# Altium project MCU.PrjPcb (part 2 of 3)

## Sheet CAN.SchDoc
size A4; SheetNumber: 6; SheetTotal: 10
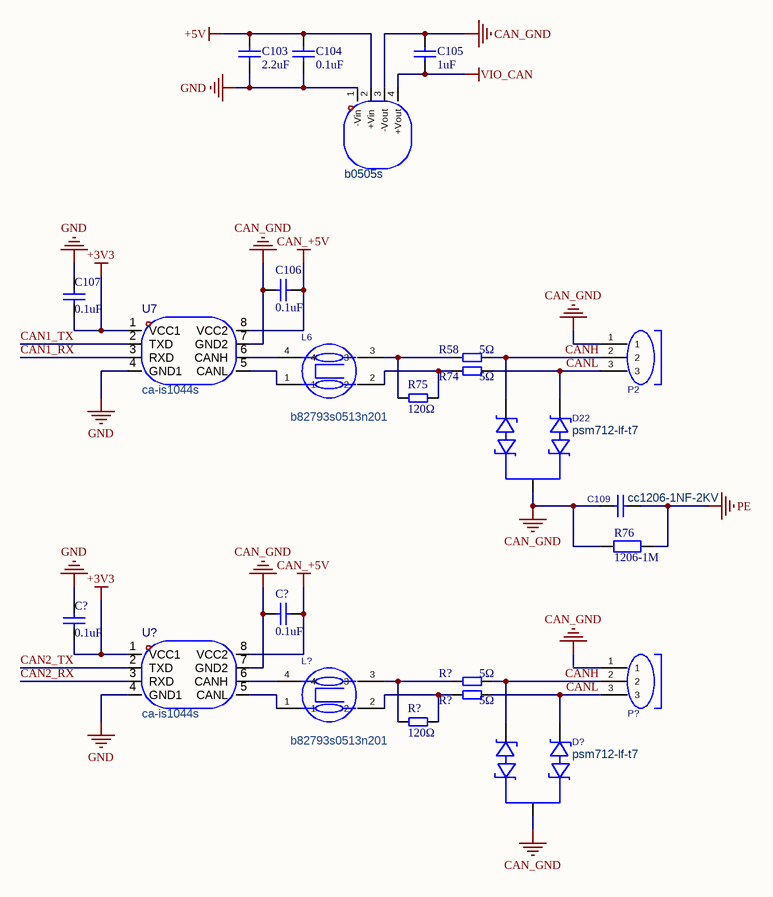
[diagram p6: CAN.SchDoc]

### Parts
(Parts that share a designator on the sheet are numbered #1, #2 ... from top to bottom, then left to right.)
C103  2.2uF  [C0603]
C104  0.1uF  [C0603]
C105  1uF  [C0603]
C106  0.1uF  [C0603]
C107  0.1uF  [C0603]
C109  cc1206-1NF-2KV  [C1206]
C?#23  0.1uF  [C0603]
C?#24  0.1uF  [C0603]
D22  psm712-lf-t7  [SOT-23-3_L3.0-W1.7-P0.95-LS2.9-BR]
D?#13  psm712-lf-t7  [SOT-23-3_L3.0-W1.7-P0.95-LS2.9-BR]
L6  b82793s0513n201  [FILTER-SMD_4P-L9.0-W6.0_B82790]
L?#2  b82793s0513n201  [FILTER-SMD_4P-L9.0-W6.0_B82790]
P2  wj500v-5.08-03p-14-00a  [CONN-TH_3P-P3.81_WJ15EDGRC-3.81-3P]  (value not drawn)
P?  wj500v-5.08-03p-14-00a  [CONN-TH_3P-P3.81_WJ15EDGRC-3.81-3P]  (value not drawn)
R58  5Ω  [R0603]
R74  5Ω  [R0603]
R75  120Ω  [R0603]
R76  1206-1M  [F1206]
R?#62  5Ω  [R0603]
R?#63  5Ω  [R0603]
R?#64  120Ω  [R0603]
U7  ca-is1044s  [SOIC-8_L4.9-W3.9-P1.27-LS6.0-BL]
U?#4  ca-is1044s  [SOIC-8_L4.9-W3.9-P1.27-LS6.0-BL]
  b0505s  [PWRM-TH_B0505S-1WR3]

### Nets
+3V3: C107.1 C?#24.1 U7.1(VCC1) U?#4.1(VCC1)
+5V: C103.2 C104.2 .2(+Vin)
CAN_+5V: C106.2 C?#23.2 U7.8(VCC2) U?#4.8(VCC2)
CAN_GND: C105.2 C106.1 C109.1 C?#23.1 D22.3(K) D?#13.3(K) P2.1 P?.1 R76.1 U7.7(GND2) U?#4.7(GND2) .3(-Vout)
GND: C103.1 C104.1 C107.2 C?#24.2 U7.4(GND1) U?#4.4(GND1) .1(-Vin)
PE: C109.2 R76.2
VIO_CAN: C105.1 .4(+Vout)
CAN1_RX: U7.3(RXD)
CAN1_TX: U7.2(TXD)
CAN2_RX: U?#4.3(RXD)
CAN2_TX: U?#4.2(TXD)
CANH: D22.2(A1) D?#13.2(A1) P2.2 P?.2 R58.2 R?#62.2
CANL: D22.1(A1) D?#13.1(A1) P2.3 P?.3 R74.2 R?#63.2
NetL6_1: L6.1 U7.5(CANL)
NetL6_2: L6.2 R74.1 R75.2
NetL6_3: L6.3 R58.1 R75.1
NetL6_4: L6.4 U7.6(CANH)
NetL?#2_1: L?#2.1 U?#4.5(CANL)
NetL?#2_2: L?#2.2 R?#63.1 R?#64.2
NetL?#2_3: L?#2.3 R?#62.1 R?#64.1
NetL?#2_4: L?#2.4 U?#4.6(CANH)

### Library data of the parts
C103-C107 C?#23 C?#24 = C0603: Capacitor; Value: 104; Published: 8-Jun-2000; LatestRevisionDate: 17-Jul-2002; LatestRevisionNote: Re-released for DXP Platform.; Publisher: Altium Limited
C109 = cc1206kkx7rdbb102: 容值:1nF;精度:±10%;额定电压:2kV;温度系数:X7R;; Manufacturer: YAGEO(国巨); AddInBom: yes; ModelId: e4be705b945545a48e666415e3682bd8; ModelName: C1206_L3.2-W1.6-H1.3; ModelTransform: 125.984,62.992,0,0,0,0,0,0,0; Value: 1nF; Tolerance: ±10%; Voltage Rating: 2kV; Temperature Coefficient: X7R; Symbol: CC1206KKX7RDBB102; LCSC Part Name: 1nF ±10% 2kV; SupplierPart: C23631; ManufacturerPart: CC1206KKX7RDBB102; Supplier Footprint: 1206; JLCPCB Part Class: Extended Part; Datasheet: https://item.szlcsc.com/datasheet/CC1206KKX7RDBB102/24367.html; Supplier: LCSC; ConvertToPcb: yes; FootprintName: C1206
D22 D?#13 = psm712-lf-t7: 极性:单向;反向截止电压(Vrwm):12V;钳位电压:19V;峰值脉冲电流(Ipp):34A@8/20us；30A@8/20us;峰值脉冲功率(Ppp):600W@8/20us;击穿电压(VBR):13.3V;; Manufacturer: PROTEK; AddInBom: yes; ModelId: 89cb27a44ab2466697082bb9fd73a7d0; ModelName: SOT-23-3L_L2.9-W1.6-H1.1-LS2.8-P0.95; ModelTransform: 114.173,110.236,0,90,0,0,0,0,0; Polarity: 单向; Reverse Stand-Off Voltage (Vrwm): 12V; Clamping Voltage: 19V; Voltage - Breakdown: 13.3V; Reverse Leakage Current (Ir): 1uA；20uA; level of protection: IEC 61000-4-4；IEC 61000-4-5；IEC 61000-4-2; Type: TVS; Junction Capacitance: 75pF; Symbol: PSM712-LF-T7; LCSC Part Name: 单向TVS 12V截止 峰值浪涌电流：34A@8/20us 30A@8/20us; SupplierPart: C32677; ManufacturerPart: PSM712-LF-T7; Supplier Footprint: SOT-23; JLCPCB Part Class: Basic Part; Datasheet: https://item.szlcsc.com/datasheet/PSM712-LF-T7/33642.html; Supplier: LCSC; ConvertToPcb: yes; FootprintName: SOT-23-3_L3.0-W1.7-P0.95-LS2.9-BR; Peak Pulse Current (Ipp): 34A@8/20us；30A@8/20us; Peak Pulse Power Dissipation (Ppp): 600W@8/20us; Operating Temperature: -55℃~+150℃
L6 L?#2 = b82793s0513n201: 通道数:2;电感@频率:51uH@100kHz;直流电阻(DCR):140mΩ;; Manufacturer: TDK; Symbol: B82793S513N201; AddInBom: yes; ModelId: 4e9188432b8b448ba84ed56da6aff49a; ModelName: FILTER-SMD_4P-L7.1-W6.0-H4.8-LS9.0; ModelTransform: 355.35937,236.22,0,90,0,0,-0.034,0,0; Number of Lines: 2; Current Rating: 800mA; Voltage Rating - DC: 80V; Voltage Rating (AC): 42V; Voltage Withstand: 250V; DC Resistance(DCR): 140mΩ; LCSC Part Name: 两路 贴片共模滤波器; SupplierPart: C97047; ManufacturerPart: B82793S0513N201; Supplier Footprint: SMD; JLCPCB Part Class: Extended Part; Datasheet: https://item.szlcsc.com/datasheet/B82793S0513N201/98252.html; Supplier: LCSC; ConvertToPcb: yes; FootprintName: FILTER-SMD_4P-L9.0-W6.0_B82790; Inductance @ Frequency: 51uH@100kHz; Operating Temperature: -40℃~+125℃
P2 P? = WJ15EDGRC-3.81-03P-14-00A: 结构:1x3P;间距:5.08mm;颜色:绿色;安装类型:直插;排数:1;每排PIN数:3;额定电流:18A;额定电压:250V;线规 - AWG:14~30;线规 - 平方毫米:2.5;工作温度:-40℃~+105℃;; Manufacturer: KANGNEX(康奈克斯电气); Symbol: WJ500V-5.08-3P-14-00A; AddInBom: yes; ModelId: f80d5090781743d49abcb05979f5618f; ModelName: CONN-TH_3P-P5.00_WJ500V-5.08-3P; ModelTransform: 623.621,393.7,0,0,0,0,11.811,-20.315,-177.165; Number of Positions or Pins: 1x3P; Pitch: 5.08mm; Number of PINs Per Row: 3; Screw Specification: M2.5; Current Rating: 18A; Voltage Rating (Max): 250V; Wire Gauge - AWG: 14~30; Wire Gauge - mm2: 2.5; LCSC Part Name: 1x3P 5.08mm 直插 排数:1 每排P数:3; SupplierPart: C72334; ManufacturerPart: WJ500V-5.08-03P-14-00A; Supplier Footprint: 插件,P=5.08mm; JLCPCB Part Class: Extended Part; Datasheet: https://item.szlcsc.com/datasheet/WJ500V-5.08-03P-14-00A/73443.html; Supplier: LCSC; ConvertToPcb: yes; FootprintName: CONN-TH_3P-P5.00_WJ500V-5.08-3P; Color: 绿色; Mounting Type: 直插; Number of Pins: 3P; Number of Rows: 1; Operating Temperature: -40℃~+105℃; Height Above Board: 14.07mm
R58 R74 R75 R?#62-R?#64 = 0603-1KΩ-5%: 片式电阻; 物料描述: 片式电阻器-0805-10KΩ-5%-JT; 物料号: NA
R76 = R1206: 特性：I Hold：0.05 ~ 3.0A。 快速响应故障电流。 尺寸1206 / 3.2×1.6mm。 低电阻。 低轮廓。 符合RoHS标准，无铅且无卤。应用：USB集线器、端口和外围设备。 计算机、手机、多媒体设备; Published: 8-Jun-2000; LatestRevisionDate: 17-Jul-2002; LatestRevisionNote: Re-released for DXP Platform.; Publisher: Altium Limited
U7 U?#4 = ca-is1044s: 隔离CAN; Manufacturer: Chipanalog(川土微); AddInBom: yes; ModelId: e81d2f7d937b4a6ab1dca543ff5d56a4; ModelName: SOIC-8_L4.9-W3.9-H1.7-LS6.0-P1.27; ModelTransform: 192.913,236.22,0,0,0,0,0,0,0; Data Rate(Max): 2Mbps; Isolation Voltage(Vrms): 3750; CMTI(kV/us): 100kV/us; Symbol: CA-IS1044S; LCSC Part Name: CA-IS1044S 3.75kVRMS 隔离 CAN 收发器; SupplierPart: C7424699; ManufacturerPart: CA-IS1044S; Supplier Footprint: SOIC-8-NB; JLCPCB Part Class: Extended Part; Datasheet: https://item.szlcsc.com/datasheet/CA-IS1044S/8412095.html; Supplier: LCSC; ConvertToPcb: yes; FootprintName: SOIC-8_L4.9-W3.9-P1.27-LS6.0-BL; Features: 失效安全；总线故障检测与保护; Operating Temperature: -40℃~+125℃
 = b0505s-1wr3_c7465178: B0505S-1WR3型号是定电压输入,隔离非稳压单路输出的DC/DC模块电源产品；输入电压5V(4.5V~5.5V)，输出电压5Vdc，输出电流200mA，输出功率1W;转换效率86%;低静态电流，低纹波系数和低噪音，超低功耗;输出可持续短路保护，自恢复;最大容性负载2400uF;适用于纯数字电路，一般低频模拟电路，继电器驱动电路，数据交换电路等 ;输入输出隔离耐压1.5KVdc ;尺寸：长11.68*高10.16*宽6.00mm; Manufacturer: EVISUN(易成); AddInBom: yes; ModelId: 30eab2842705423fac4a2e76b933247c; ModelTransform: 456.692,236.22,0,0,0,0,0,82.677,-157.48; Number of Outputs: 1; Output Power: 1W; Conversion Efficiency: 86%; Output Voltage: 5V; Output Current(Max): 200mA; Capacitive Load(Max): 2400uF; Isolation Voltage(Vrms): 1.5kV; Value: 200kHz~340kHz; Quiescent Supply Current: 6mA; Ripple Noise: 30mVp-p; Voltage Regulation: 非稳压型

## Sheet EMMC.SchDoc
size A4; SheetNumber: 7; SheetTotal: 10
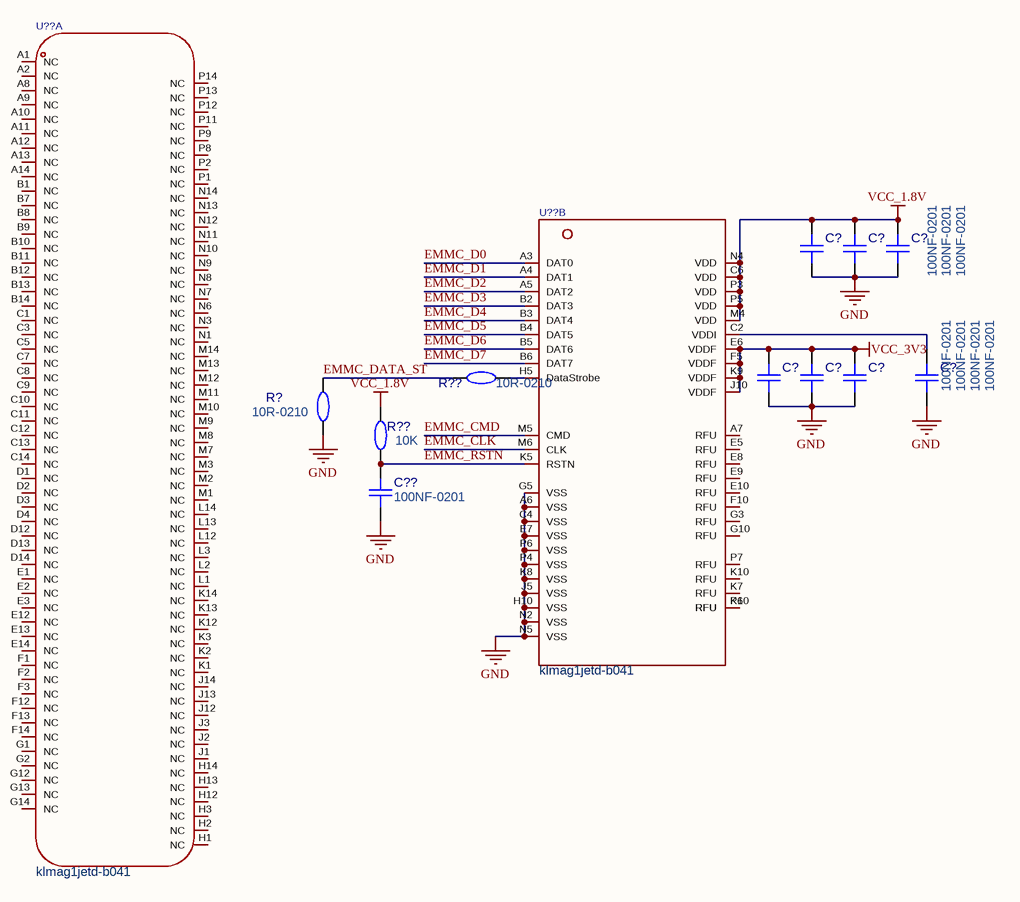
[diagram p7: EMMC.SchDoc]

### Parts
(Parts that share a designator on the sheet are numbered #1, #2 ... from top to bottom, then left to right.)
C?#25  100NF-0201  [C0201]
C?#26  100NF-0201  [C0201]
C?#27  100NF-0201  [C0201]
C?#28  100NF-0201  [C0201]
C?#29  100NF-0201  [C0201]
C?#30  100NF-0201  [C0201]
C?#31  100NF-0201  [C0201]
C??  100NF-0201  [C0201]
R?#65  10R-0210  [R0201]
R??#1  10R-0210  [R0201]
R??#2  10K  [R0201]
U??#1  klmag1jetd-b041  [FBGA-153_L13.0-W11.5-P0.50_KLMAG1JETD-B041]  (part B of 2)
U??#2  klmag1jetd-b041  [FBGA-153_L13.0-W11.5-P0.50_KLMAG1JETD-B041]  (part A of 2)

### Nets
GND: C?#25.1 C?#26.1 C?#27.1 C?#28.1 C?#29.1 C?#30.1 C?#31.1 C??.1 R?#65.2 U??#1.A6(VSS) U??#1.C4(VSS) U??#1.E7(VSS) U??#1.G5(VSS) U??#1.H10(VSS) U??#1.J5(VSS) U??#1.K8(VSS) U??#1.N2(VSS) U??#1.N5(VSS) U??#1.P4(VSS) U??#1.P6(VSS)
VCC_1.8V: C?#25.2 C?#26.2 C?#27.2 R??#2.2 U??#1.C6(VDD) U??#1.M4(VDD) U??#1.N4(VDD) U??#1.P3(VDD) U??#1.P5(VDD)
VCC_3V3: C?#28.2 C?#29.2 C?#30.2 U??#1.E6(VDDF) U??#1.F5(VDDF) U??#1.J10(VDDF) U??#1.K9(VDDF)
EMMC_CLK: U??#1.M6(CLK)
EMMC_CMD: U??#1.M5(CMD)
EMMC_D0: U??#1.A3(DAT0)
EMMC_D1: U??#1.A4(DAT1)
EMMC_D2: U??#1.A5(DAT2)
EMMC_D3: U??#1.B2(DAT3)
EMMC_D4: U??#1.B3(DAT4)
EMMC_D5: U??#1.B4(DAT5)
EMMC_D6: U??#1.B5(DAT6)
EMMC_D7: U??#1.B6(DAT7)
EMMC_DATA_ST: R?#65.1 R??#1.1
EMMC_RSTN: C??.2 R??#2.1 U??#1.K5(RSTN)
NetC?#31_2: C?#31.2 U??#1.C2(VDDI)
NetR??#1_2: R??#1.2 U??#1.H5(DataStrobe)
NetU??#1_K6: U??#1.K6(RFU) U??#1.P10(RFU)

Not connected (* = marked no-connect by the designer): U??#1 A7(RFU) E5(RFU) E8(RFU) E9(RFU) E10(RFU) F10(RFU) G3(RFU) G10(RFU) K7(RFU) K10(RFU) P7(RFU); U??#2 A1(NC) A2(NC) A8(NC) A9(NC) A10(NC) A11(NC) A12(NC) A13(NC) A14(NC) B1(NC) B7(NC) B8(NC) B9(NC) B10(NC) B11(NC) B12(NC) B13(NC) B14(NC) C1(NC) C3(NC) C5(NC) C7(NC) C8(NC) C9(NC) C10(NC) C11(NC) C12(NC) C13(NC) C14(NC) D1(NC) D2(NC) D3(NC) D4(NC) D12(NC) D13(NC) D14(NC) E1(NC) E2(NC) E3(NC) E12(NC) E13(NC) E14(NC) F1(NC) F2(NC) F3(NC) F12(NC) F13(NC) F14(NC) G1(NC) G2(NC) G12(NC) G13(NC) G14(NC) H1(NC) H2(NC) H3(NC) H12(NC) H13(NC) H14(NC) J1(NC) J2(NC) J3(NC) J12(NC) J13(NC) J14(NC) K1(NC) K2(NC) K3(NC) K12(NC) K13(NC) K14(NC) L1(NC) L2(NC) L3(NC) L12(NC) L13(NC) L14(NC) M1(NC) M2(NC) M3(NC) M7(NC) M8(NC) M9(NC) M10(NC) M11(NC) M12(NC) M13(NC) M14(NC) N1(NC) N3(NC) N6(NC) N7(NC) N8(NC) N9(NC) N10(NC) N11(NC) N12(NC) N13(NC) N14(NC) P1(NC) P2(NC) P8(NC) P9(NC) P11(NC) P12(NC) P13(NC) P14(NC)

### Library data of the parts
C?#25-C?#31 C?? = 0201-C: 容值:1uF;精度:±20%;额定电压:6.3V;温度系数:X5R;; Manufacturer: muRata(村田); Symbol: GRM033R60J105MEA2D; AddInBom: yes; ModelId: e8033a7cb35143ffb28e3b81b2577ea0; ModelName: C0201_L0.6-W0.3-H0.3; ModelTransform: 23.622,11.811,0,0,0,0,0,0,0; Value: 1uF; Tolerance: ±20%; Voltage Rating: 6.3V; Temperature Coefficient: X5R; LCSC Part Name: 1uF ±20% 6.3V; SupplierPart: C76930; ManufacturerPart: GRM033R60J105MEA2D; Supplier Footprint: 0201; JLCPCB Part Class: Extended Part; Datasheet: https://item.szlcsc.com/datasheet/GRM033R60J105MEA2D/78057.html; Supplier: LCSC; ConvertToPcb: yes; FootprintName: C0201
R?#65 R??#1 R??#2 = 0210-R: 电阻类型:厚膜电阻;阻值:10kΩ;精度:±1%;功率:50mW;工作电压:25V;温度系数:±200ppm/℃;; Manufacturer: YAGEO(国巨); Symbol: RC0201FR-0710KL; AddInBom: yes; ModelId: 0e006ba4c37b4b73b0e85d5d1c6800cb; ModelName: R0201_L0.6-W0.3-H0.3; ModelTransform: 23.622,11.811,0,0,0,0,0,-0.0005,0; Value: 10kΩ; Tolerance: ±1%; Power(Watts): 50mW; Voltage-Supply(Max): 25V; LCSC Part Name: 厚膜电阻 10kΩ ±1% 50mW; SupplierPart: C106225; ManufacturerPart: RC0201FR-0710KL; Supplier Footprint: 0201; JLCPCB Part Class: Extended Part; Datasheet: https://item.szlcsc.com/datasheet/RC0201FR-0710KL/107440.html; Supplier: LCSC; ConvertToPcb: yes; FootprintName: R0201; Type: 厚膜电阻; Temperature Coefficient: ±200ppm/℃; Operating Temperature: -55℃~+125℃
U??#1 U??#2 = klmag1jetd-b041: NAND闪存类型:-;协议版本:eMMC 5.1;存储容量:16GB;; Manufacturer: SAMSUNG(三星半导体); AddInBom: yes; ModelId: e295469cf8df408b9f13391ad06a16e8; ModelName: FBGA-153_L13.0-W11.5-H1.1-P0.50_KLMAG1JETD-B041; ModelTransform: 452.755,511.81,0,0,0,0,0,0,0; Memory Size: 16GB; Reading Speed in Sequence: 330MB/S; Writing Speed in Sequence: 50MB/S; NAND Operating Voltage (VCCF): 2.7V~3.6V; Controller Operating Voltage (VCCQ): 2.7V~3.6V；1.7V~1.95V; Symbol: KLMAG1JETD-B041; LCSC Part Name: 嵌入式多媒体卡，兼容eMMC 5.1规范，支持HS400模式; SupplierPart: C499919; ManufacturerPart: KLMAG1JETD-B041; Supplier Footprint: FBGA-153; JLCPCB Part Class: Extended Part; Datasheet: https://item.szlcsc.com/datasheet/KLMAG1JETD-B041/512099.html; Supplier: LCSC; ConvertToPcb: yes; FootprintName: FBGA-153_L13.0-W11.5-P0.50_KLMAG1JETD-B041; NAND Flash Type: -; Protocol Version: eMMC 5.1; Operating Temperature: -25℃~+85℃; NAND Stand-By Current: -; Controller Stand-By Current: -; Features: 硬件复位功能；ECC纠错功能；内置磨损均衡功能；坏块管理功能；安全写保护功能

## Sheet OSPI_FLASH、EEPROM.SchDoc
size A4; SheetNumber: 8; SheetTotal: 10
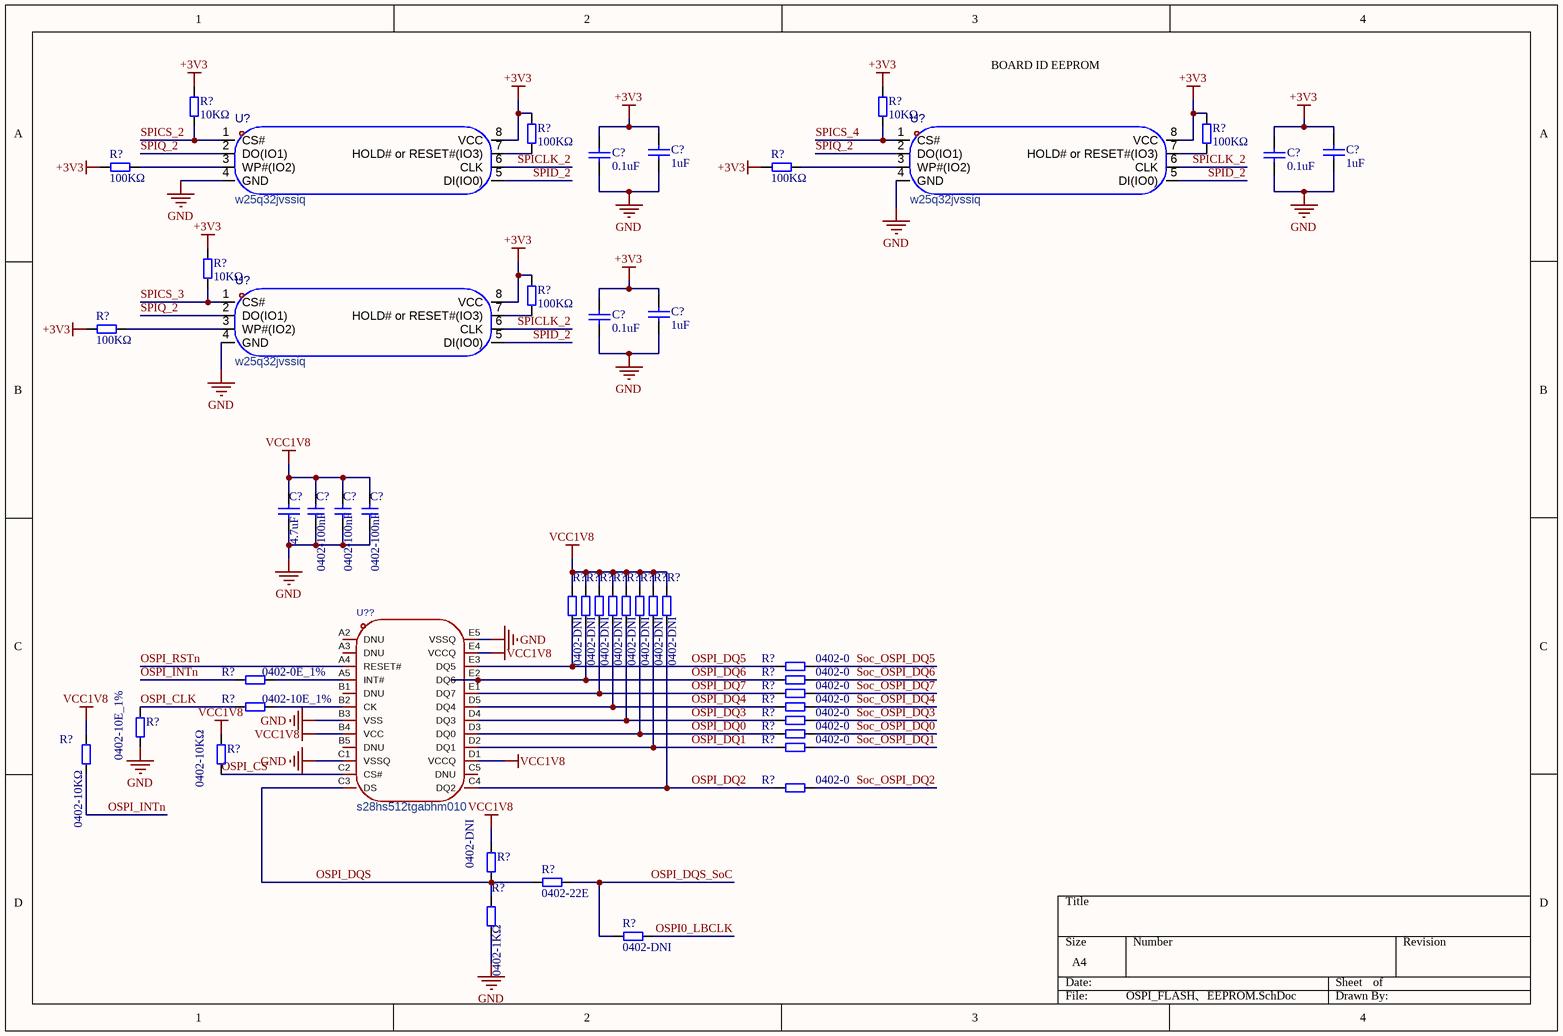
[diagram p8: OSPI_FLASH、EEPROM.SchDoc]

### Parts
(Parts that share a designator on the sheet are numbered #1, #2 ... from top to bottom, then left to right.)
C?#32  0.1uF  [C0603]
C?#33  1uF  [C0603]
C?#34  0.1uF  [C0603]
C?#35  1uF  [C0603]
C?#36  0.1uF  [C0603]
C?#37  1uF  [C0603]
C?#38  0402-100nF  [C0402]
C?#39  0402-100nF  [C0402]
C?#40  0402-100nF  [C0402]
C?#41  4.7uF  [C0603]
R?#66  10KΩ  [R0603]
R?#67  10KΩ  [R0603]
R?#68  100KΩ  [R0603]
R?#69  100KΩ  [R0603]
R?#70  100KΩ  [R0603]
R?#71  100KΩ  [R0603]
R?#72  10KΩ  [R0603]
R?#73  100KΩ  [R0603]
R?#74  100KΩ  [R0603]
R?#75  0402-DNI  [R0402]
R?#76  0402-DNI  [R0402]
R?#77  0402-DNI  [R0402]
R?#78  0402-DNI  [R0402]
R?#79  0402-DNI  [R0402]
R?#80  0402-DNI  [R0402]
R?#81  0402-DNI  [R0402]
R?#82  0402-DNI  [R0402]
R?#83  0402-0  [R0402]
R?#84  0402-0E_1%  [R0402]
R?#85  0402-0  [R0402]
R?#86  0402-0  [R0402]
R?#87  0402-10E_1%  [R0402]
R?#88  0402-10E_1%  [R0402]
R?#89  0402-0  [R0402]
R?#90  0402-0  [R0402]
R?#91  0402-0  [R0402]
R?#92  0402-0  [R0402]
R?#93  0402-10KΩ  [R0402]
R?#94  0402-10KΩ  [R0402]
R?#95  0402-0  [R0402]
R?#96  0402-DNI  [R0402]
R?#97  0402-22E  [R0402]
R?#98  0402-1KΩ  [R0402]
R?#99  0402-DNI  [R0402]
U?#5  w25q32jvssiq  [SOIC-8_L5.3-W5.3-P1.27-LS8.0-BL]
U?#6  w25q32jvssiq  [SOIC-8_L5.3-W5.3-P1.27-LS8.0-BL]
U?#7  w25q32jvssiq  [SOIC-8_L5.3-W5.3-P1.27-LS8.0-BL]
U??#3  s28hs512tgabhm010  [FBGA-24_L8.0-W6.0-P1.00-BL_SPANSION_VAA024]

### Nets
+3V3: C?#32.2 C?#33.2 C?#34.2 C?#35.2 C?#36.2 C?#37.2 R?#66.1 R?#67.1 R?#68.2 R?#69.2 R?#70.2 R?#71.2 R?#72.1 R?#73.2 R?#74.2 U?#5.8(VCC) U?#6.8(VCC) U?#7.8(VCC)
GND: C?#32.1 C?#33.1 C?#34.1 C?#35.1 C?#36.1 C?#37.1 C?#38.2 C?#39.2 C?#40.2 C?#41.1 R?#87.2 R?#98.1 U?#5.4(GND) U?#6.4(GND) U?#7.4(GND) U??#3.B3(VSS) U??#3.C1(VSSQ) U??#3.E5(VSSQ)
VCC1V8: C?#38.1 C?#39.1 C?#40.1 C?#41.2 R?#75.1 R?#76.1 R?#77.1 R?#78.1 R?#79.1 R?#80.1 R?#81.1 R?#82.1 R?#93.2 R?#94.2 R?#96.1 U??#3.B4(VCC) U??#3.D1(VCCQ) U??#3.E4(VCCQ)
OSPI0_LBCLK: R?#99.2
OSPI_CLK: R?#87.1 R?#88.2
OSPI_CS: R?#94.1 U??#3.C2(CS#)
OSPI_DQ0: R?#80.2 R?#91.1 U??#3.D3(DQ0)
OSPI_DQ1: R?#81.2 R?#92.1 U??#3.D2(DQ1)
OSPI_DQ2: R?#82.2 R?#95.1 U??#3.C4(DQ2)
OSPI_DQ3: R?#79.2 R?#90.1 U??#3.D4(DQ3)
OSPI_DQ4: R?#78.2 R?#89.1 U??#3.D5(DQ4)
OSPI_DQ5: R?#75.2 R?#83.1 U??#3.E3(DQ5)
OSPI_DQ6: R?#76.2 R?#85.1 U??#3.E2(DQ6)
OSPI_DQ7: R?#77.2 R?#86.1 U??#3.E1(DQ7)
OSPI_DQS: R?#96.2 R?#97.1 R?#98.2 U??#3.C3(DS)
OSPI_DQS_SoC: R?#97.2 R?#99.1
OSPI_INTn: R?#84.2 R?#93.1
OSPI_RSTn: U??#3.A4(RESET#)
Soc_OSPI_DQ0: R?#91.2
Soc_OSPI_DQ1: R?#92.2
Soc_OSPI_DQ2: R?#95.2
Soc_OSPI_DQ3: R?#90.2
Soc_OSPI_DQ4: R?#89.2
Soc_OSPI_DQ5: R?#83.2
Soc_OSPI_DQ6: R?#85.2
Soc_OSPI_DQ7: R?#86.2
SPICLK_2: U?#5.6(CLK) U?#6.6(CLK) U?#7.6(CLK)
SPICS_2: R?#66.2 U?#5.1(CS#)
SPICS_3: R?#72.2 U?#7.1(CS#)
SPICS_4: R?#67.2 U?#6.1(CS#)
SPID_2: U?#5.5(DI(IO0)) U?#6.5(DI(IO0)) U?#7.5(DI(IO0))
SPIQ_2: U?#5.2(DO(IO1)) U?#6.2(DO(IO1)) U?#7.2(DO(IO1))
NetR?#68_1: R?#68.1 U?#5.7(HOLD#_or_RESET#(IO3))
NetR?#69_1: R?#69.1 U?#6.7(HOLD#_or_RESET#(IO3))
NetR?#70_1: R?#70.1 U?#5.3(WP#(IO2))
NetR?#71_1: R?#71.1 U?#6.3(WP#(IO2))
NetR?#73_1: R?#73.1 U?#7.7(HOLD#_or_RESET#(IO3))
NetR?#74_1: R?#74.1 U?#7.3(WP#(IO2))
NetR?#84_1: R?#84.1 U??#3.A5(INT#)
NetR?#88_1: R?#88.1 U??#3.B2(CK)

Not connected (* = marked no-connect by the designer): U??#3 A2(DNU) A3(DNU) B1(DNU) B5(DNU) C5(DNU)

### Notes on the sheet
- BOARD ID EEPROM

### Library data of the parts
C?#32-C?#37 C?#41 = C0603: Capacitor; Value: 104; Published: 8-Jun-2000; LatestRevisionDate: 17-Jul-2002; LatestRevisionNote: Re-released for DXP Platform.; Publisher: Altium Limited
C?#38-C?#40 = C0402: 物料号: *; 物料描述: *
R?#66-R?#74 = 0603-1KΩ-5%: as R58 on sheet CAN
R?#75-R?#99 = R0402: as R?#1 on sheet SDRAM，JTAG，I2C EEPROM，SD Card
U?#5-U?#7 = w25q32jvssiq: 接口类型:SPI;存储容量:32Mbit;时钟频率(fc):133MHz;; Manufacturer: Winbond(华邦); Symbol: W25Q32JVSSIQ_C179173; AddInBom: yes; ModelId: f83d990ad74f400caf5ac920b7771508; ModelName: SOIC-8_L5.3-W5.3-H1.9-LS7.9-P1.27; ModelTransform: 208.661,311.25654,0,0,0,0,-0.0005,0.0005,0; Interface: SPI; Memory Size: 32Mbit; Clock Frequency: 133MHz; Voltage - Supply: 2.7V~3.6V; Standby Supply Current: 1uA; Program / Erase Cycles: 100000次; Page Programming Time (Tpp): 3ms; Data Retention - TDR (Year): 20年; LCSC Part Name: 支持双线、四线SPI接口的3V、32Mbit 串行SPI闪存; SupplierPart: C179173; ManufacturerPart: W25Q32JVSSIQ; Supplier Footprint: SOIC-8-208mil; JLCPCB Part Class: Extended Part; Datasheet: https://item.szlcsc.com/datasheet/W25Q32JVSSIQ/190567.html; Supplier: LCSC; ConvertToPcb: yes; FootprintName: SOIC-8_L5.3-W5.3-P1.27-LS8.0-BL; Write Cycle Time (tWC): -; Block Erase Time(tBE): -; Operating Temperature: -40℃~+85℃; Features: 硬件写保护；绝对写保护；写使能锁存；软件写保护；上电复位
U??#3 = s28hs512tgabhm010: 接口类型:SPI;存储容量:512Mbit;时钟频率(fc):200MHz;; Manufacturer: Infineon(英飞凌); AddInBom: yes; ModelId: 5d8ea78fdb834f3b8db8343aac7ee720; ModelTransform: 314.96,236.22,0,0,0,0,0,0,0; Interface: SPI; Clock Frequency: 200MHz; Voltage - Supply: 1.7V~2V; Standby Supply Current: 11uA; Program / Erase Cycles: 1280000次; Page Programming Time (Tpp): 753us; Data Retention - TDR (Year): 25年; Symbol: S28HS512TGABHM010; LCSC Part Name: 256-Mb/512-Mb/1-Gb HS-T/HL-T 八线接口闪存; SupplierPart: C6801624; ManufacturerPart: S28HS512TGABHM010; Supplier Footprint: FBGA-24(6x8); JLCPCB Part Class: Extended Part; Datasheet: https://item.szlcsc.com/datasheet/S28HS512TGABHM010/7762037.html; Supplier: LCSC; ConvertToPcb: yes; FootprintName: FBGA-24_L8.0-W6.0-P1.00-BL_SPANSION_VAA024; ModelName: FBGA-24_L8.0-W6.0-P1.00-BL_SPANSION_VAA024; Memory Size: 512Mbit; Write Cycle Time (tWC): -; Block Erase Time(tBE): -; Operating Temperature: -40℃~+85℃; Features: ECC纠错；上电复位

## Sheet BOOT_MODE_BUFFER&SWITCHES.SchDoc
size A4; SheetNumber: 11; SheetTotal: 18
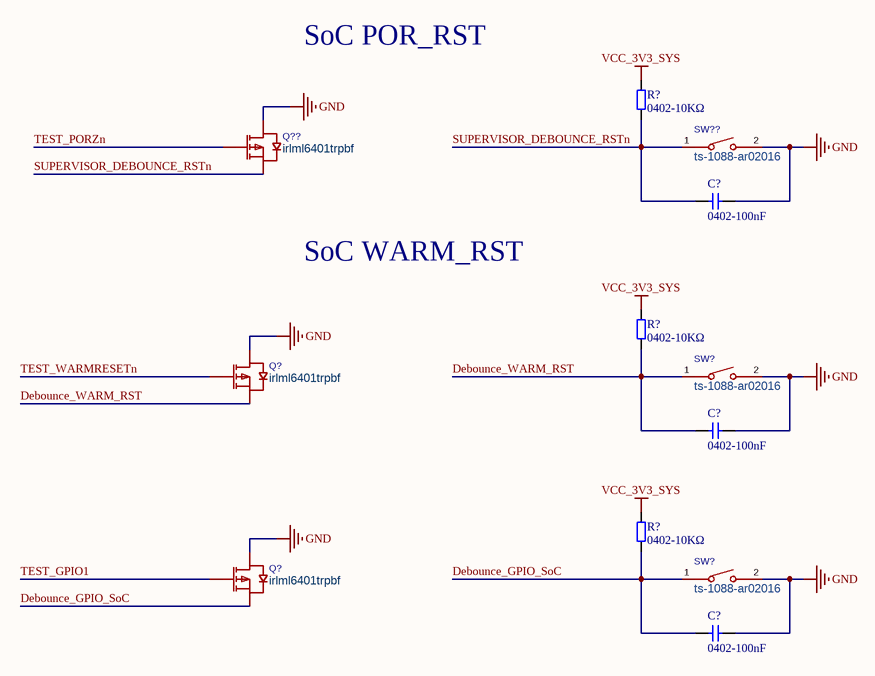
[diagram p9: BOOT_MODE_BUFFER&SWITCHES.SchDoc]

### Parts
(Parts that share a designator on the sheet are numbered #1, #2 ... from top to bottom, then left to right.)
C?#42  0402-100nF  [C0402]
C?#43  0402-100nF  [C0402]
C?#44  0402-100nF  [C0402]
Q?#1  irlml6401trpbf  [SOT-23-3_L2.9-W1.3-P1.90-LS2.4-BR]
Q?#2  irlml6401trpbf  [SOT-23-3_L2.9-W1.3-P1.90-LS2.4-BR]
Q??#1  irlml6401trpbf  [SOT-23-3_L2.9-W1.3-P1.90-LS2.4-BR]
R?#100  0402-10KΩ  [R0402]
R?#101  0402-10KΩ  [R0402]
R?#102  0402-10KΩ  [R0402]
SW?#1  ts-1088-ar02016  [SW-SMD_L3.9-W3.0-P4.45]
SW?#2  ts-1088-ar02016  [SW-SMD_L3.9-W3.0-P4.45]
SW??  ts-1088-ar02016  [SW-SMD_L3.9-W3.0-P4.45]

### Nets
GND: C?#42.2 C?#43.2 C?#44.2 Q?#1.3(D) Q?#2.3(D) Q??#1.3(D) SW?#1.2 SW?#2.2 SW??.2
VCC_3V3_SYS: R?#100.2 R?#101.2 R?#102.2
Debounce_GPIO_SoC: C?#44.1 Q?#2.2(S) R?#102.1 SW?#2.1
Debounce_WARM_RST: C?#43.1 Q?#1.2(S) R?#101.1 SW?#1.1
SUPERVISOR_DEBOUNCE_RSTn: C?#42.1 Q??#1.2(S) R?#100.1 SW??.1
TEST_GPIO1: Q?#2.1(G)
TEST_PORZn: Q??#1.1(G)
TEST_WARMRESETn: Q?#1.1(G)

### Notes on the sheet
- SoC POR_RST
- SoC WARM_RST

### Library data of the parts
C?#42-C?#44 = C0402: 物料号: *; 物料描述: *
Q?#1 Q?#2 Q??#1 = irlml6401trpbf: 数量:1个P沟道;漏源电压(Vdss):12V;连续漏极电流(Id):4.3A;导通电阻(RDS(on)):50mΩ@4.5V;耗散功率(Pd):1.3W;阈值电压(Vgs(th)):950mV;; Manufacturer: Infineon(英飞凌); AddInBom: yes; ModelId: c62791f0466c4ae2a892c056b845b0ca; ModelName: SOT-23-3P_L2.9-W1.3-H1.0-LS2.4-P0.95; ModelTransform: 98.425,114.173,0,180,0,0,0.0005,-0.0005,0; Number: 1个P沟道; Drain to Source Voltage: 12V; Current - Continuous Drain(Id): 4.3A; Pd - Power Dissipation: 1.3W; Gate Threshold Voltage (Vgs(th)): 950mV; Gate Charge(Qg): 15nC@5V; Input Capacitance(Ciss): 830pF; Reverse Transfer Capacitance (Crss@Vds): 125pF; Type: P沟道; Output Capacitance(Coss): 180pF; Vgs: ±8V; Symbol: IRLML6401TRPBF; LCSC Part Name: 1个P沟道 耐压:12V 电流:4.3A; SupplierPart: C3034; ManufacturerPart: IRLML6401TRPBF; Supplier Footprint: SOT-23; JLCPCB Part Class: Extended Part; Datasheet: https://item.szlcsc.com/datasheet/IRLML6401TRPBF/3416.html; Supplier: LCSC; ConvertToPcb: yes; FootprintName: SOT-23-3_L2.9-W1.3-P1.90-LS2.4-BR; RDS(on): 50mΩ@4.5V; Operating Temperature: -55℃~+150℃; Configuration: -
R?#100-R?#102 = R0402: as R?#1 on sheet SDRAM，JTAG，I2C EEPROM，SD Card
SW?#1 SW?#2 SW?? = ts-1088-ar02016: 电路结构:单刀单掷;按钮形状:圆形按钮;作用力:1.6N;安装方式:立贴;开关长度:3.9mm;开关宽度:3mm;开关高度:2mm;带支架:不带支架;触点电流:50mA;额定电压:12V;带灯:-;工作寿命:10万次;; Manufacturer: XUNPU(讯普); AddInBom: yes; ModelId: b26698b69f274ffabef8a26c7d0e5dd1; ModelName: SW-SMD_L3.9-W2.9-H2.0-LS4.8; ModelTransform: 188.976,114.174,0,0,0,0,0,0,0; Circuit: 单刀单掷; Actuator Style: 圆形按钮; Operating Force: 1.6N; Switch Height: 2mm; with Bracket: 不带支架; Contact Current: 50mA; Voltage Rating: 12V; Actuator/Cap Color: 黑色; Life: 10万次; Symbol: TS-1088-AR02016; LCSC Part Name: 3.9*3*2mm 立贴 轻触开关; SupplierPart: C720477; ManufacturerPart: TS-1088-AR02016; Supplier Footprint: SMD,4x3mm; JLCPCB Part Class: Basic Part; Datasheet: https://item.szlcsc.com/datasheet/TS-1088-AR02016/763484.html; Supplier: LCSC; ConvertToPcb: yes; FootprintName: SW-SMD_L3.9-W3.0-P4.45; Mounting Type: 立贴; Length: 3.9mm; Width: 3mm; With Lamp: -; IP Rating: -; Termination Style: SMD接片; Operating Temperature: -30℃~+80℃

## Sheet MIMP.SchDoc
size A4; SheetNumber: 12; SheetTotal: 14

## Sheet DDR4.SchDoc
size A3; SheetNumber: 8; SheetTotal: 9
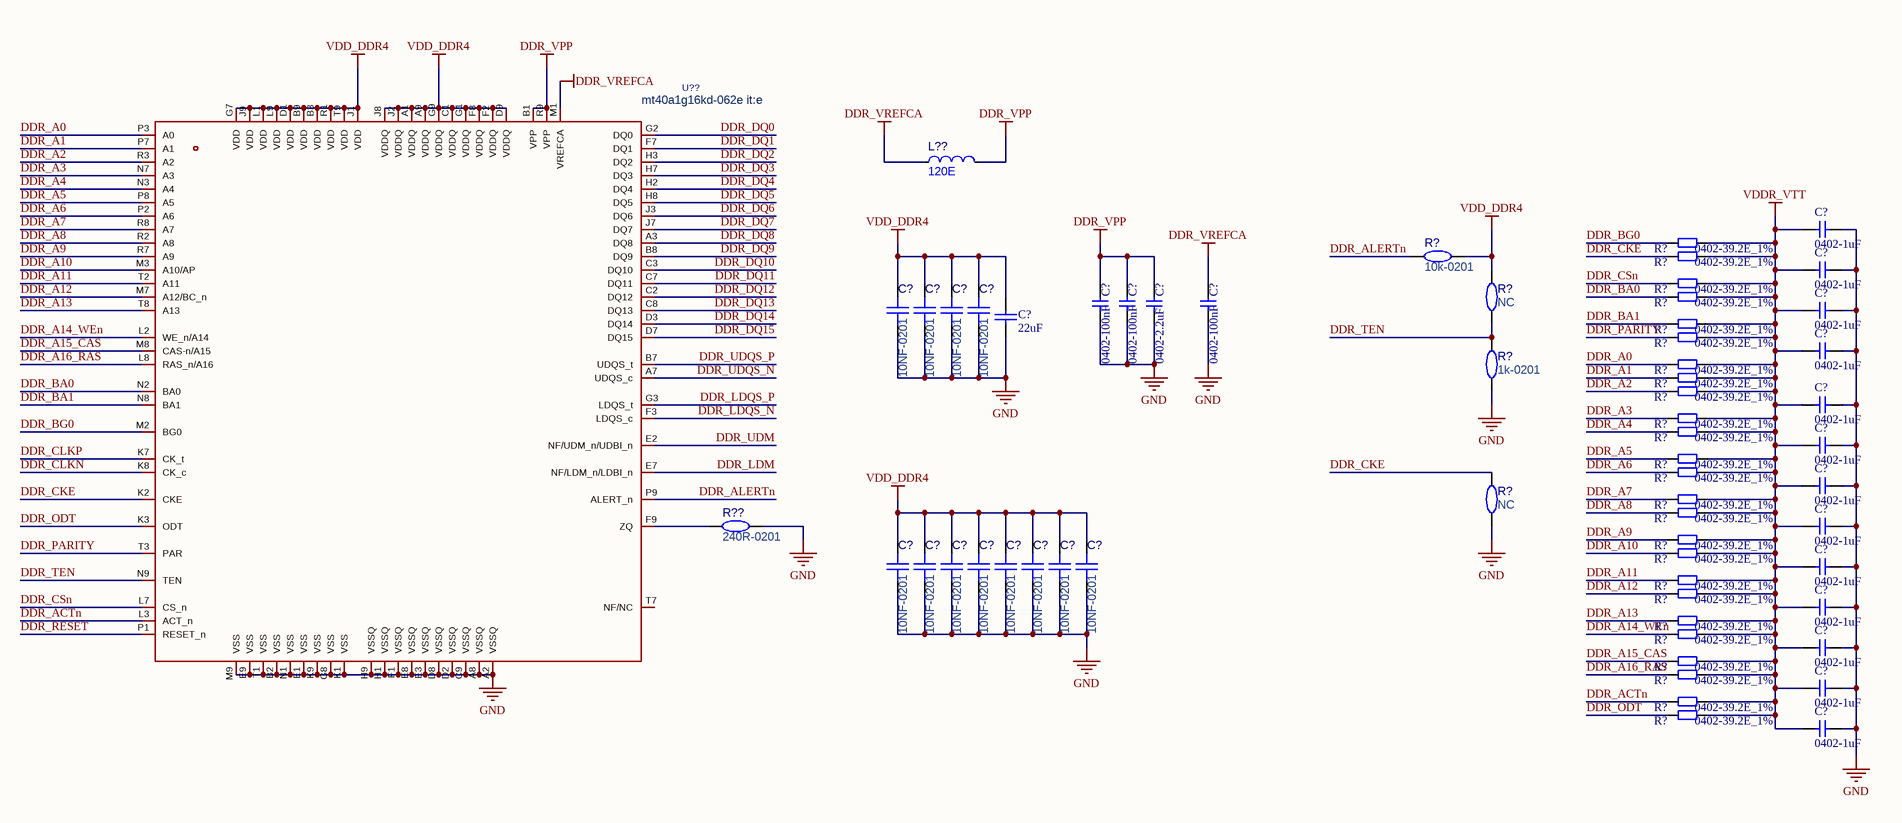
[diagram p10: DDR4.SchDoc]

### Parts
(Parts that share a designator on the sheet are numbered #1, #2 ... from top to bottom, then left to right.)
C?#45  0402-1uF  [C0402]
C?#46  0402-1uF  [C0402]
C?#47  0402-100nF  [C0402]
C?#48  0402-100nF  [C0402]
C?#49  0402-2.2uF  [C0402]
C?#50  0402-100nF  [C0402]
C?#51  10NF-0201  [C0201]
C?#52  10NF-0201  [C0201]
C?#53  10NF-0201  [C0201]
C?#54  10NF-0201  [C0201]
C?#55  0402-1uF  [C0402]
C?#56  22uF  [C0805]
C?#57  0402-1uF  [C0402]
C?#58  0402-1uF  [C0402]
C?#59  0402-1uF  [C0402]
C?#60  0402-1uF  [C0402]
C?#61  0402-1uF  [C0402]
C?#62  10NF-0201  [C0201]
C?#63  10NF-0201  [C0201]
C?#64  10NF-0201  [C0201]
C?#65  10NF-0201  [C0201]
C?#66  10NF-0201  [C0201]
C?#67  10NF-0201  [C0201]
C?#68  10NF-0201  [C0201]
C?#69  10NF-0201  [C0201]
C?#70  0402-1uF  [C0402]
C?#71  0402-1uF  [C0402]
C?#72  0402-1uF  [C0402]
C?#73  0402-1uF  [C0402]
C?#74  0402-1uF  [C0402]
L??#1  120E  [L0603]
R?#103  0402-39.2E_1%  [R0402]
R?#104  10k-0201  [R0201]
R?#105  0402-39.2E_1%  [R0402]
R?#106  0402-39.2E_1%  [R0402]
R?#107  NC  [R0201]
R?#108  0402-39.2E_1%  [R0402]
R?#109  0402-39.2E_1%  [R0402]
R?#110  0402-39.2E_1%  [R0402]
R?#111  1k-0201  [R0201]
R?#112  0402-39.2E_1%  [R0402]
R?#113  0402-39.2E_1%  [R0402]
R?#114  0402-39.2E_1%  [R0402]
R?#115  0402-39.2E_1%  [R0402]
R?#116  0402-39.2E_1%  [R0402]
R?#117  0402-39.2E_1%  [R0402]
R?#118  0402-39.2E_1%  [R0402]
R?#119  NC  [R0201]
R?#120  0402-39.2E_1%  [R0402]
R?#121  0402-39.2E_1%  [R0402]
R?#122  0402-39.2E_1%  [R0402]
R?#123  0402-39.2E_1%  [R0402]
R?#124  0402-39.2E_1%  [R0402]
R?#125  0402-39.2E_1%  [R0402]
R?#126  0402-39.2E_1%  [R0402]
R?#127  0402-39.2E_1%  [R0402]
R?#128  0402-39.2E_1%  [R0402]
R?#129  0402-39.2E_1%  [R0402]
R?#130  0402-39.2E_1%  [R0402]
R?#131  0402-39.2E_1%  [R0402]
R??#3  240R-0201  [R0201]
U??#4  mt40a1g16kd-062e it:e  [FBGA-96_L13.0-W9.0-R16-C6-P0.80-TL]

### Nets
DDR_VPP: C?#47.1 C?#48.1 C?#49.1 L??#1.2 U??#4.B1(VPP) U??#4.R9(VPP)
DDR_VREFCA: C?#50.1 L??#1.1 U??#4.M1(VREFCA)
GND: C?#45.2 C?#46.2 C?#47.2 C?#48.2 C?#49.2 C?#50.2 C?#51.1 C?#52.1 C?#53.1 C?#54.1 C?#55.2 C?#56.1 C?#57.2 C?#58.2 C?#59.2 C?#60.2 C?#61.2 C?#62.1 C?#63.1 C?#64.1 C?#65.1 C?#66.1 C?#67.1 C?#68.1 C?#69.1 C?#70.2 C?#71.2 C?#72.2 C?#73.2 C?#74.2 R?#111.1 R?#119.1 R??#3.2 U??#4.A2(VSSQ) U??#4.A8(VSSQ) U??#4.B2(VSS) U??#4.C9(VSSQ) U??#4.D2(VSSQ) U??#4.D8(VSSQ) U??#4.E1(VSS) U??#4.E3(VSSQ) U??#4.E8(VSSQ) U??#4.E9(VSS) U??#4.F1(VSSQ) U??#4.G8(VSS) U??#4.H1(VSSQ) U??#4.H9(VSSQ) U??#4.K1(VSS) U??#4.K9(VSS) U??#4.M9(VSS) U??#4.N1(VSS) U??#4.T1(VSS)
VDD_DDR4: C?#51.2 C?#52.2 C?#53.2 C?#54.2 C?#56.2 C?#62.2 C?#63.2 C?#64.2 C?#65.2 C?#66.2 C?#67.2 C?#68.2 C?#69.2 R?#104.2 R?#107.2 U??#4.A1(VDDQ) U??#4.A9(VDDQ) U??#4.B3(VDD) U??#4.B9(VDD) U??#4.C1(VDDQ) U??#4.D1(VDD) U??#4.D9(VDDQ) U??#4.F2(VDDQ) U??#4.F8(VDDQ) U??#4.G1(VDDQ) U??#4.G7(VDD) U??#4.G9(VDDQ) U??#4.J1(VDD) U??#4.J2(VDDQ) U??#4.J8(VDDQ) U??#4.J9(VDD) U??#4.L1(VDD) U??#4.L9(VDD) U??#4.R1(VDD) U??#4.T9(VDD)
VDDR_VTT: C?#45.1 C?#46.1 C?#55.1 C?#57.1 C?#58.1 C?#59.1 C?#60.1 C?#61.1 C?#70.1 C?#71.1 C?#72.1 C?#73.1 C?#74.1 R?#103.2 R?#105.2 R?#106.2 R?#108.2 R?#109.2 R?#110.2 R?#112.2 R?#113.2 R?#114.2 R?#115.2 R?#116.2 R?#117.2 R?#118.2 R?#120.2 R?#121.2 R?#122.2 R?#123.2 R?#124.2 R?#125.2 R?#126.2 R?#127.2 R?#128.2 R?#129.2 R?#130.2 R?#131.2
DDR_A0: R?#112.1 U??#4.P3(A0)
DDR_A1: R?#113.1 U??#4.P7(A1)
DDR_A2: R?#114.1 U??#4.R3(A2)
DDR_A3: R?#115.1 U??#4.N7(A3)
DDR_A4: R?#116.1 U??#4.N3(A4)
DDR_A5: R?#117.1 U??#4.P8(A5)
DDR_A6: R?#118.1 U??#4.P2(A6)
DDR_A7: R?#120.1 U??#4.R8(A7)
DDR_A8: R?#121.1 U??#4.R2(A8)
DDR_A9: R?#122.1 U??#4.R7(A9)
DDR_A10: R?#123.1 U??#4.M3(A10/AP)
DDR_A11: R?#124.1 U??#4.T2(A11)
DDR_A12: R?#125.1 U??#4.M7(A12/BC_n)
DDR_A13: R?#126.1 U??#4.T8(A13)
DDR_A14_WEn: R?#127.1 U??#4.L2(WE_n/A14)
DDR_A15_CAS: R?#128.1 U??#4.M8(CAS-n/A15)
DDR_A16_RAS: R?#129.1 U??#4.L8(RAS_n/A16)
DDR_ACTn: R?#130.1 U??#4.L3(ACT_n)
DDR_ALERTn: R?#104.1 U??#4.P9(ALERT_n)
DDR_BA0: R?#108.1 U??#4.N2(BA0)
DDR_BA1: R?#109.1 U??#4.N8(BA1)
DDR_BG0: R?#103.1 U??#4.M2(BG0)
DDR_CKE: R?#105.1 R?#119.2 U??#4.K2(CKE)
DDR_CLKN: U??#4.K8(CK_c)
DDR_CLKP: U??#4.K7(CK_t)
DDR_CSn: R?#106.1 U??#4.L7(CS_n)
DDR_DQ0: U??#4.G2(DQ0)
DDR_DQ1: U??#4.F7(DQ1)
DDR_DQ2: U??#4.H3(DQ2)
DDR_DQ3: U??#4.H7(DQ3)
DDR_DQ4: U??#4.H2(DQ4)
DDR_DQ5: U??#4.H8(DQ5)
DDR_DQ6: U??#4.J3(DQ6)
DDR_DQ7: U??#4.J7(DQ7)
DDR_DQ8: U??#4.A3(DQ8)
DDR_DQ9: U??#4.B8(DQ9)
DDR_DQ10: U??#4.C3(DQ10)
DDR_DQ11: U??#4.C7(DQ11)
DDR_DQ12: U??#4.C2(DQ12)
DDR_DQ13: U??#4.C8(DQ13)
DDR_DQ14: U??#4.D3(DQ14)
DDR_DQ15: U??#4.D7(DQ15)
DDR_LDM: U??#4.E7(NF/LDM_n/LDBI_n)
DDR_LDQS_N: U??#4.F3(LDQS_c)
DDR_LDQS_P: U??#4.G3(LDQS_t)
DDR_ODT: R?#131.1 U??#4.K3(ODT)
DDR_PARITY: R?#110.1 U??#4.T3(PAR)
DDR_RESET: U??#4.P1(RESET_n)
DDR_TEN: R?#107.1 R?#111.2 U??#4.N9(TEN)
DDR_UDM: U??#4.E2(NF/UDM_n/UDBI_n)
DDR_UDQS_N: U??#4.A7(UDQS_c)
DDR_UDQS_P: U??#4.B7(UDQS_t)
NetR??#3_1: R??#3.1 U??#4.F9(ZQ)

Not connected (* = marked no-connect by the designer): U??#4 T7(NF/NC)

### Library data of the parts
C?#45-C?#50 C?#55 C?#57-C?#61 C?#70-C?#74 = C0402: 物料号: *; 物料描述: *
C?#51-C?#54 C?#62-C?#69 = 0201-C: 容值:1uF;精度:±20%;额定电压:6.3V;温度系数:X5R;; Manufacturer: muRata(村田); Symbol: GRM033R60J105MEA2D; AddInBom: yes; ModelId: e8033a7cb35143ffb28e3b81b2577ea0; ModelName: C0201_L0.6-W0.3-H0.3; ModelTransform: 23.622,11.811,0,0,0,0,0,0,0; Value: 1uF; Tolerance: ±20%; Voltage Rating: 6.3V; Temperature Coefficient: X5R; LCSC Part Name: 1uF ±20% 6.3V; SupplierPart: C76930; ManufacturerPart: GRM033R60J105MEA2D; Supplier Footprint: 0201; JLCPCB Part Class: Extended Part; Datasheet: https://item.szlcsc.com/datasheet/GRM033R60J105MEA2D/78057.html; Supplier: LCSC; ConvertToPcb: yes; FootprintName: C0201
C?#56 = C0805: Capacitor; Value: 104; Published: 8-Jun-2000; LatestRevisionDate: 17-Jul-2002; LatestRevisionNote: Re-released for DXP Platform.; Publisher: Altium Limited
L??#1 = L0603: 电感值:10uH;精度:±10%;额定电流:3mA;饱和电流(Isat):-;直流电阻(DCR):1.85Ω;; Manufacturer: Sunlord(顺络); Symbol: SDFL1608S100KTF; AddInBom: yes; ModelId: 2bc5ec593d464d6ba9807aec0b5673c2; ModelName: L0603_L1.6-W0.8-H0.5_BEAD; ModelTransform: 62.992,31.496,0,180,0,0,0.094,0.629,0; Value: 10uH; Tolerance: ±10%; Current Rating: 3mA; DC Resistance(DCR): 1.85Ω; Q @ Frequency: 30@2MHz; Frequency - Self Resonant: 17MHz; LCSC Part Name: 10uH ±10%; SupplierPart: C1035; ManufacturerPart: SDFL1608S100KTF; Supplier Footprint: 0603; JLCPCB Part Class: Basic Part; Datasheet: https://item.szlcsc.com/datasheet/SDFL1608S100KTF/1387.html; Supplier: LCSC; ConvertToPcb: yes; FootprintName: L0603; Current - Saturation (Isat): -; Ratings: -
R?#103 R?#105 R?#106 R?#108-R?#110 R?#112-R?#118 R?#120-R?#131 = R0402: 片式电阻; 物料描述: 片式电阻器-0805-10KΩ-5%-JT; 物料号: NA
R?#104 R?#107 R?#111 R?#119 R??#3 = 0210-R: 电阻类型:厚膜电阻;阻值:10kΩ;精度:±1%;功率:50mW;工作电压:25V;温度系数:±200ppm/℃;; Manufacturer: YAGEO(国巨); Symbol: RC0201FR-0710KL; AddInBom: yes; ModelId: 0e006ba4c37b4b73b0e85d5d1c6800cb; ModelName: R0201_L0.6-W0.3-H0.3; ModelTransform: 23.622,11.811,0,0,0,0,0,-0.0005,0; Value: 10kΩ; Tolerance: ±1%; Power(Watts): 50mW; Voltage-Supply(Max): 25V; LCSC Part Name: 厚膜电阻 10kΩ ±1% 50mW; SupplierPart: C106225; ManufacturerPart: RC0201FR-0710KL; Supplier Footprint: 0201; JLCPCB Part Class: Extended Part; Datasheet: https://item.szlcsc.com/datasheet/RC0201FR-0710KL/107440.html; Supplier: LCSC; ConvertToPcb: yes; FootprintName: R0201; Type: 厚膜电阻; Temperature Coefficient: ±200ppm/℃; Operating Temperature: -55℃~+125℃
U??#4 = mt40a1g16kd-062e it:e: 特性：VDD = VDDQ = 1.2V ± 60mV。VPP = 2.5V-125mV + 250mV。On-die, internal, adjustable VREFDQ generation。1.2V pseudo open-drain I/O。TC maximum up to 95°C。64ms, 8192-cycle refresh up to 85°C; Manufacturer: micron(镁光); AddInBom: yes; ModelId: 84b52cecb1cd4cbe82c7ffb61f530f61; ModelTransform: 354.33,511.81,0,0,0,0,0,0,0; Symbol: MT40A1G16KD-062E IT:E; LCSC Part Name: 16Gb：X4、x8、X16 DDR4 SDRAM; SupplierPart: C5330483; ManufacturerPart: MT40A1G16KD-062E IT:E; Supplier Footprint: FBGA-96; JLCPCB Part Class: Extended Part; Datasheet: https://item.szlcsc.com/datasheet/MT40A1G16KD-062E%2520IT%253AE/6089440.html; Supplier: LCSC; ConvertToPcb: yes; FootprintName: FBGA-96_L13.0-W9.0-R16-C6-P0.80-TL; ModelName: FBGA-96_L13.0-W9.0-R16-C6-P0.80-TL

## Sheet sys-power.SchDoc
size A4; SheetNumber: 14; SheetTotal: 17
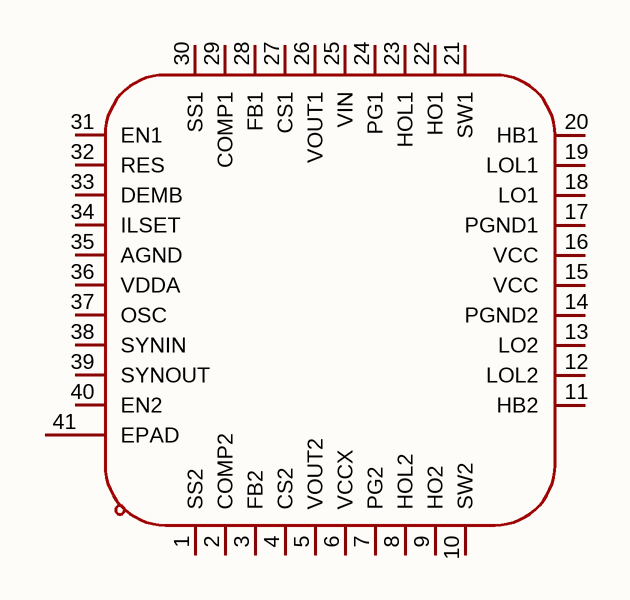
[diagram p11: sys-power.SchDoc]

### Parts
(Parts that share a designator on the sheet are numbered #1, #2 ... from top to bottom, then left to right.)
U??#5  lm5140qrwgtq1  [VQFN-40_L6.0-W6.0-P0.50-BL-EP]  (value not drawn)

### Nets

Not connected (* = marked no-connect by the designer): U??#5 1(SS2) 2(COMP2) 3(FB2) 4(CS2) 5(VOUT2) 6(VCCX) 7(PG2) 8(HOL2) 9(HO2) 10(SW2) 11(HB2) 12(LOL2) 13(LO2) 14(PGND2) 15(VCC) 16(VCC) 17(PGND1) 18(LO1) 19(LOL1) 20(HB1) 21(SW1) 22(HO1) 23(HOL1) 24(PG1) 25(VIN) 26(VOUT1) 27(CS1) 28(FB1) 29(COMP1) 30(SS1) 31(EN1) 32(RES) 33(DEMB) 34(ILSET) 35(AGND) 36(VDDA) 37(OSC) 38(SYNIN) 39(SYNOUT) 40(EN2) 41(EPAD)

### Library data of the parts
U??#5 = lm5140qrwgtq1: 功能类型:降压型;工作电压:3.8V~65V;输出电压:1.5V~15V;输出电流:-;输出类型:可调;; Manufacturer: TI(德州仪器); AddInBom: yes; ModelId: 9abaade914744556b7a2df475e9925e7; ModelName: VQFN-40_L6.0-W6.0-H1.0-P0.50; ModelTransform: 237.007,237.007,0,90,0,0,-0.005,0.005,0; Function: 降压型; Frequency - Switching: 440kHz; Synchronous Rectifier: 是; Number of Outputs: 2; Topology: 降压式; Quiescent Current: 35uA; Switch tube (built-in/external): 外置; Output Type: 可调; Symbol: LM5140QRWGTQ1; LCSC Part Name: 降压型 3.8V~65V; SupplierPart: C201623; ManufacturerPart: LM5140QRWGTQ1; Supplier Footprint: VQFN-40-EP(6x6); JLCPCB Part Class: Extended Part; Datasheet: https://www.ti.com/cn/lit/gpn/lm5140-q1; Supplier: LCSC; ConvertToPcb: yes; FootprintName: VQFN-40_L6.0-W6.0-P0.50-BL-EP; Voltage - Supply: 3.8V~65V; Output Voltage: 1.5V~15V; Output Current: -; Operating Temperature: -40℃~+150℃@(TJ); Features: 轻载高效模式；频率同步；逐波限流；可调软启动；过流保护；工作状态指示；可调限流；打嗝限流

## Sheet bootload_wifi.SchDoc
size A4; SheetNumber: 15; SheetTotal: 17
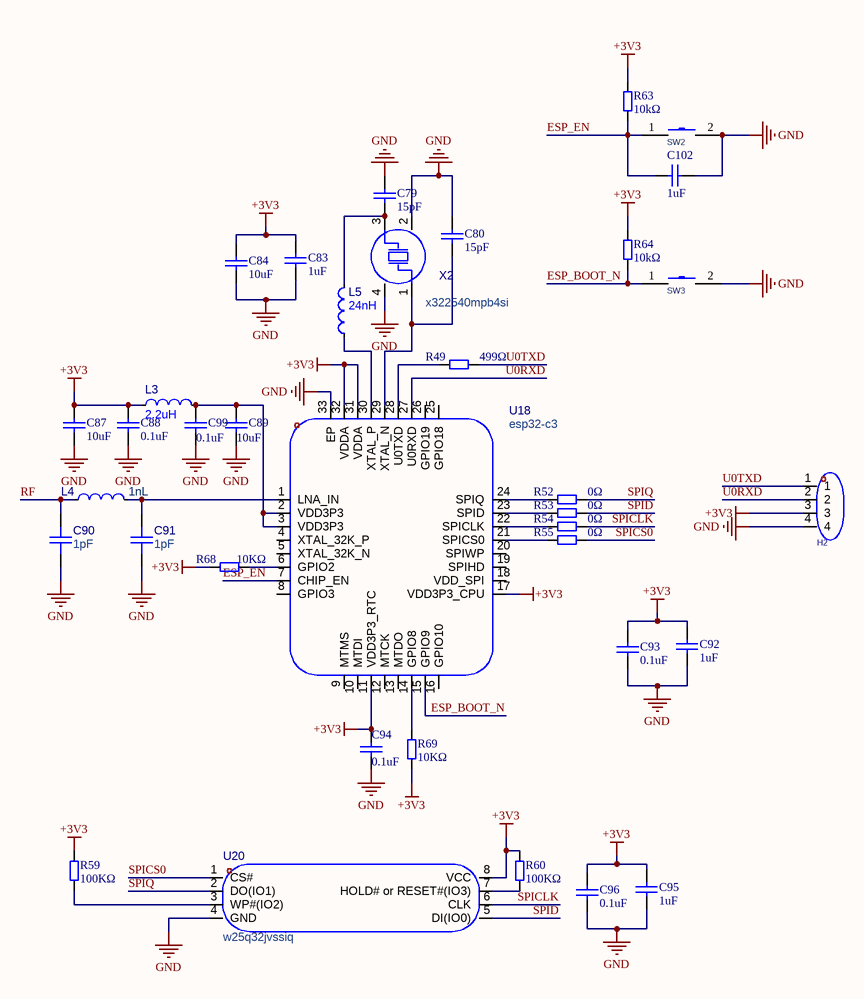
[diagram p12: bootload_wifi.SchDoc]

### Parts
C79  15pF  [C0603]
C80  15pF  [C0603]
C83  1uF  [C0603]
C84  10uF  [C0603]
C87  10uF  [C0603]
C88  0.1uF  [C0603]
C89  10uF  [C0603]
C90  1pF  [C0201]
C91  1pF  [C0201]
C92  1uF  [C0603]
C93  0.1uF  [C0603]
C94  0.1uF  [C0603]
C95  1uF  [C0603]
C96  0.1uF  [C0603]
C99  0.1uF  [C0603]
C102  1uF  [C0603]
H2  lail-pz2.54-4p-l  [CONN-TH_LAIL-PZ2.54-4P-L]  (value not drawn)
L3  2.2uH  [L0603]
L4  1nL  [L0201-RD]
L5  24nH  [L0603]
R49  499Ω  [R0603]
R52  0Ω  [R0603]
R53  0Ω  [R0603]
R54  0Ω  [R0603]
R55  0Ω  [R0603]
R59  100KΩ  [R0603]
R60  100KΩ  [R0603]
R63  10kΩ  [R0603]
R64  10kΩ  [R0603]
R68  10KΩ  [R0603]
R69  10KΩ  [R0603]
SW2  TS-1101-C-W  [SW-SMD_L6.0-W3.3-LS8.0]  (value not drawn)
SW3  TS-1101-C-W  [SW-SMD_L6.0-W3.3-LS8.0]  (value not drawn)
U18  esp32-c3  [QFN-32_L5.0-W5.0-P0.50-TL-EP3.7]
U20  w25q32jvssiq  [SOIC-8_L5.3-W5.3-P1.27-LS8.0-BL]
X2  x322540mpb4si  [OSC-SMD_4P-L3.2-W2.5-BL_SIT8008BI]

### Nets
+3V3: C83.2 C84.2 C87.2 C88.2 C92.2 C93.2 C94.2 C95.2 C96.2 H2.3 L3.1 R59.2 R60.2 R63.2 R64.2 R68.2 R69.1 U18.11(VDD3P3_RTC) U18.17(VDD3P3_CPU) U18.31(VDDA) U18.32(VDDA) U20.8(VCC)
GND: C79.1 C80.2 C83.1 C84.1 C87.1 C88.1 C89.1 C90.1 C91.1 C92.1 C93.1 C94.1 C95.1 C96.1 C99.1 C102.1 H2.4 SW2.2 SW3.2 U18.33(EP) U20.4(GND) X2.2(GND) X2.4(GND)
ESP_BOOT_N: R64.1 SW3.1 U18.15(GPIO9)
ESP_EN: C102.2 R63.1 SW2.1 U18.7(CHIP_EN)
RF: C90.2 L4.1
SPICLK: R54.2 U20.6(CLK)
SPICS0: R55.2 U20.1(CS#)
SPID: R53.2 U20.5(DI(IO0))
SPIQ: R52.2 U20.2(DO(IO1))
U0RXD: H2.2 U18.27(U0RXD)
U0TXD: H2.1 R49.2
NetC79_2: C79.2 L5.2 X2.3(OSC2)
NetC80_1: C80.1 U18.29(XTAL_N) X2.1(OSC1)
NetC89_2: C89.2 C99.2 L3.2 U18.2(VDD3P3) U18.3(VDD3P3)
NetC91_2: C91.2 L4.2 U18.1(LNA_IN)
NetL5_1: L5.1 U18.30(XTAL_P)
NetR49_1: R49.1 U18.28(U0TXD)
NetR52_1: R52.1 U18.24(SPIQ)
NetR53_1: R53.1 U18.23(SPID)
NetR54_1: R54.1 U18.22(SPICLK)
NetR55_1: R55.1 U18.21(SPICS0)
NetR59_1: R59.1 U20.3(WP#(IO2))
NetR60_1: R60.1 U20.7(HOLD#_or_RESET#(IO3))
NetR68_1: R68.1 U18.6(GPIO2)
NetR69_2: R69.2 U18.14(GPIO8)

Not connected (* = marked no-connect by the designer): U18 4(XTAL_32K_P) 5(XTAL_32K_N) 8(GPIO3) 9(MTMS) 10(MTDI) 12(MTCK) 13(MTDO) 16(GPIO10) 18(VDD_SPI) 19(SPIHD) 20(SPIWP) 25(GPIO18) 26(GPIO19)

### Library data of the parts
C79 C80 C83 C84 C87-C89 C92-C96 C99 C102 = C0603: Capacitor; Value: 104; Published: 8-Jun-2000; LatestRevisionDate: 17-Jul-2002; LatestRevisionNote: Re-released for DXP Platform.; Publisher: Altium Limited
C90 C91 = 0201-C: as C?#51-C?#54 on sheet DDR4; LCSC Part Name: 1uF ±20% 6.3V; SupplierPart: C76930; ManufacturerPart: GRM033R60J105MEA2D; Supplier Footprint: 0201; JLCPCB Part Class: Extended Part; Datasheet: https://item.szlcsc.com/datasheet/GRM033R60J105MEA2D/78057.html; Supplier: LCSC; ConvertToPcb: yes; FootprintName: C0201
H2 = lail-pz2.54-4p-l: 插针结构:1x4P;间距:2.54mm;圆针/方针:方针;排数:单排;总PIN位数:4P;额定电流:3A;额定电压:250V;塑高:2.5mm;端接针长度:3mm;触头材质:黄铜;触头镀层:金;工作温度:-25℃~+80℃;颜色:黑色;; Manufacturer: 莱联; AddInBom: yes; ModelId: 112b012cb4004446aa5386c9c86d05f0; ModelTransform: 400.039,100,0,0,0,0,0,0,-118.11; Pin Structure: 1x4P; Pitch: 2.54mm; Circluar Pins/Square Pins: 方针; Current Rating: 3A; Voltage Rating (Max): 250V; LCSC Part Name: 1x4P 间距:2.54mm 方针; SupplierPart: C54950602; ManufacturerPart: LAIL-PZ2.54-4P-L; Supplier Footprint: 插件,P=2.54mm; JLCPCB Part Class: Extended Part; Datasheet: https://item.szlcsc.com/datasheet/LAIL-PZ2.54-4P-L/58519955.html; Supplier: LCSC; ConvertToPcb: yes; SymbolName: LAIL-PZ2.54-4P-L; FootprintName: CONN-TH_LAIL-PZ2.54-4P-L; ModelName: CONN-TH_LAIL-PZ2.54-4P-L; Number of Rows: 单排; Number of Pins: 4P; Insulation Height: 2.5mm; Length of End Connection Pin: 3mm; Contact Material: 黄铜; Contact Plating: 金; Operating Temperature: -25℃~+80℃; Color: 黑色
L3 L5 = L0603: as L??#1 on sheet DDR4; LCSC Part Name: 10uH ±10%; SupplierPart: C1035; ManufacturerPart: SDFL1608S100KTF; Supplier Footprint: 0603; JLCPCB Part Class: Basic Part; Datasheet: https://item.szlcsc.com/datasheet/SDFL1608S100KTF/1387.html; Supplier: LCSC; ConvertToPcb: yes; FootprintName: L0603; Current - Saturation (Isat): -; Ratings: -
L4 = 0201-L: 电感值:2nH;精度:-;额定电流:600mA;饱和电流(Isat):-;直流电阻(DCR):150mΩ;; Manufacturer: muRata(村田); Symbol: LQP03TN2N0B02D; AddInBom: yes; ModelId: 62bef5db133646c7914ab8b9bdc86b60; ModelTransform: 23.622,11.811,0,0,0,0,0,0,0; Value: 2nH; Current Rating: 600mA; DC Resistance(DCR): 150mΩ; Q @ Frequency: 14@500MHz; Frequency - Self Resonant: 12.5GHz; Type: 厚膜电感; LCSC Part Name: ±0.1nH 2nH; SupplierPart: C86125; ManufacturerPart: LQP03TN2N0B02D; Supplier Footprint: 0201; JLCPCB Part Class: Extended Part; Datasheet: https://item.szlcsc.com/datasheet/LQP03TN2N0B02D/87301.html; Supplier: LCSC; ConvertToPcb: yes; FootprintName: L0201-RD; ModelName: L0201-RD; Tolerance: -; Current - Saturation (Isat): -
R49 R52-R55 R59 R60 R63 R64 R68 R69 = 0603-1KΩ-5%: 片式电阻; 物料描述: 片式电阻器-0805-10KΩ-5%-JT; 物料号: NA
SW2 SW3 = TS-1101-C-W: Manufacturer: XKB Connectivity(中国星坤); Add into BOM: yes; Circuit: 单刀单掷; Actuator Style: 矩形按钮; Operating Force: 260gf; Switch Length: 6mm; Switch Width: 3.6mm; Switch Height: 2.5mm; Strike Gundam: 不带; Contact Current: 50mA; Voltage Rating (DC): 12V; Actuator/Cap Color: 白色带淡绿; With Lamp: 无; Mechanical Life: 5万次; Symbol: TS-1101-C-W; Device: TS-1101-C-W; LCSC Part Name: 6*3.6*2.5mm 立贴 轻触开关; Supplier Part: C318938; Manufacturer Part: TS-1101-C-W; Supplier Footprint: SMD; JLCPCB Part Class: Extended Part; Datasheet: https://atta.szlcsc.com/upload/public/pdf/source/20200227/C318938_C2E53B1EEDE37D980A33616AC086DE53.pdf; Supplier: LCSC; Convert to PCB: yes; Mounting Style: 立贴; Voltage Rating (AC): -; Power Rating: -; Insulation Resistance: -; IP Rating: -; Pin Style: -; Operating Temperature: -30℃~+85℃
U18 = esp32-c3: CPU内核:其他;CPU最大主频:160MHz;CPU位数:32 Bit;; Manufacturer: ESPRESSIF(乐鑫); AddInBom: yes; ModelId: 1b373353bf024628a0546c2e0a05c449; ModelName: QFN-32_L5.0-W5.0-H0.9-P0.50-TL-EP3.7; ModelTransform: 196.85,196.85,0,0,0,0,0,0,0; CPU Core: 其他; CPU Maximum Speed: 160MHz; Core Size: 32 Bit; RAM Size: 528KB; Number of I/O: 22; ADC (Bit): 12bit; Oscillator Type: 内置+外置; Voltage - Supply: 3V~3.6V; Symbol: ESP32-C3; LCSC Part Name: 不带固件 搭载RISC-V单核CPU的超低功耗片上系统（SoC），支持2.4 GHz Wi-Fi（802.11 b/g/n）和蓝牙5（低功耗）; SupplierPart: C2838500; ManufacturerPart: ESP32-C3; Supplier Footprint: QFN-32-EP(5x5); JLCPCB Part Class: Extended Part; Datasheet: https://item.szlcsc.com/datasheet/ESP32-C3/3013220.html; Supplier: LCSC; ConvertToPcb: yes; FootprintName: QFN-32_L5.0-W5.0-P0.50-TL-EP3.7; Operating Temperature: -40℃~+105℃
U20 = w25q32jvssiq: 接口类型:SPI;存储容量:32Mbit;时钟频率(fc):133MHz;; Manufacturer: Winbond(华邦); Symbol: W25Q32JVSSIQ_C179173; AddInBom: yes; ModelId: f83d990ad74f400caf5ac920b7771508; ModelName: SOIC-8_L5.3-W5.3-H1.9-LS7.9-P1.27; ModelTransform: 208.661,311.25654,0,0,0,0,-0.0005,0.0005,0; Interface: SPI; Memory Size: 32Mbit; Clock Frequency: 133MHz; Voltage - Supply: 2.7V~3.6V; Standby Supply Current: 1uA; Program / Erase Cycles: 100000次; Page Programming Time (Tpp): 3ms; Data Retention - TDR (Year): 20年; LCSC Part Name: 支持双线、四线SPI接口的3V、32Mbit 串行SPI闪存; SupplierPart: C179173; ManufacturerPart: W25Q32JVSSIQ; Supplier Footprint: SOIC-8-208mil; JLCPCB Part Class: Extended Part; Datasheet: https://item.szlcsc.com/datasheet/W25Q32JVSSIQ/190567.html; Supplier: LCSC; ConvertToPcb: yes; FootprintName: SOIC-8_L5.3-W5.3-P1.27-LS8.0-BL; Write Cycle Time (tWC): -; Block Erase Time(tBE): -; Operating Temperature: -40℃~+85℃; Features: 硬件写保护；绝对写保护；写使能锁存；软件写保护；上电复位
X2 = x322540mpb4si: 晶振类型:贴片晶振;频率:40MHz;常温频差:±10ppm;负载电容:15pF;频率稳定度:±20ppm;; Manufacturer: YXC(扬兴晶振); AddInBom: yes; ModelId: ae22b8d143894765bc8100c37cb6356f; ModelName: OSC-SMD_4P-L3.2-W2.5-H1.0; ModelTransform: 125.984,98.425,0,0,0,0,0,0,0; Value: 40MHz; Normal temperature Frequency Tolerance: ±10ppm; Load Capacitance: 15pF; Frequency Stability: ±20ppm; Equivalent Series Resistance(ESR): 40Ω; Symbol: X322540MPB4SI; LCSC Part Name: YSX321SL 40MHZ 4P 3225 15PF ±10PPM -40~85℃ (±20PPM); SupplierPart: C9010; ManufacturerPart: X322540MPB4SI; Supplier Footprint: SMD3225-4P; JLCPCB Part Class: Extended Part; Datasheet: https://item.szlcsc.com/datasheet/X322540MPB4SI/9530.html; Supplier: LCSC; ConvertToPcb: yes; FootprintName: OSC-SMD_4P-L3.2-W2.5-BL_SIT8008BI; Type: 贴片晶振; Operating Temperature: -40℃~+85℃